# Altium schematic sheet Laser_Driver.SchDoc
size A4; Date: *******; ApprovedBy: *******; CheckedBy: None; Author: *******; CompanyName: *******; DrawnBy: Name; Engineer: *******; Organization: *******; Address1: *******; Address2: *******; Address3: *******; Address4: *******; DocumentNumber: Doc Num; Revision: *******; SheetNumber: 6; SheetTotal: 8; CurrentTime: *******; CurrentDate: *******; Time: *******; DocumentFullPathAndName: *******; DocumentName: *******; ModifiedDate: *******; ImagePath: *******; ProjectName: *******; Application_BuildNumber: *******
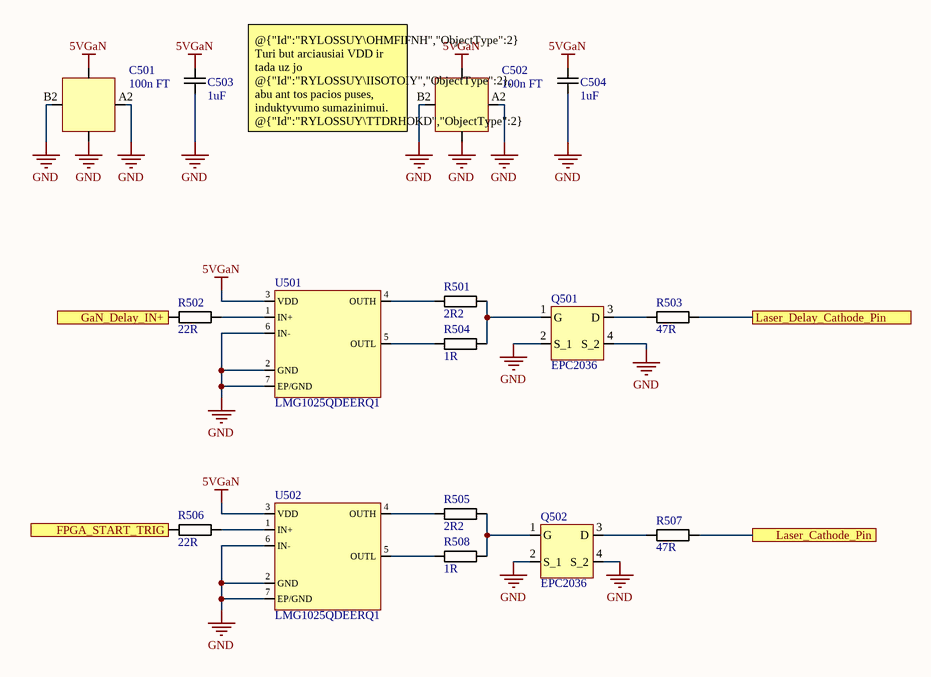
[diagram p0: Laser_Driver.SchDoc]

## Parts
C501  100n FT  [100n FT 0603]
C502  100n FT  [100n FT 0603]
C503  1uF  [1uF 0603]
C504  1uF  [1uF 0603]
Q501  EPC2036  [EPC2036]
Q502  EPC2036  [EPC2036]
R501  2R2  [2R2 0402]
R502  22R  [22R 0402]
R503  47R  [1R 0402]
R504  1R  [1R 0402]
R505  2R2  [2R2 0402]
R506  22R  [22R 0402]
R507  47R  [1R 0402]
R508  1R  [1R 0402]
U501  LMG1025QDEERQ1  [LMG1025QDEERQ1]
U502  LMG1025QDEERQ1  [LMG1025QDEERQ1]

## Ports
FPGA_START_TRIG (see Inputs_Outputs[3C]), GaN_Delay_IN+ (see Time_Delay[4B]), Laser_Cathode_Pin (see Laser_System[1C]), Laser_Delay_Cathode_Pin (see Laser_System[1B])

## Nets
5VGaN: C501.3(OUTPUT) C502.3(OUTPUT) C503.2 C504.2 U501.3(VDD) U502.3(VDD)
GND: C501.1(INPUT) C501.A2(GND_1) C501.B2(GND_2) C502.1(INPUT) C502.A2(GND_1) C502.B2(GND_2) C503.1 C504.1 Q501.2(S_1) Q501.4(S_2) Q502.2(S_1) Q502.4(S_2) U501.2(GND) U501.6(IN-) U501.7(EP/GND) U502.2(GND) U502.6(IN-) U502.7(EP/GND)
FPGA_START_TRIG: R506.2 ; port FPGA_START_TRIG
GaN_Delay_IN+: R502.2 ; port GaN_Delay_IN+
Laser_Cathode_Pin: R507.2 ; port Laser_Cathode_Pin
Laser_Delay_Cathode_Pin: R503.2 ; port Laser_Delay_Cathode_Pin
NetQ501_1: Q501.1(G) R501.2 R504.2
NetQ501_3: Q501.3(D) R503.1
NetQ502_1: Q502.1(G) R505.2 R508.2
NetQ502_3: Q502.3(D) R507.1
NetR501_1: R501.1 U501.4(OUTH)
NetR502_1: R502.1 U501.1(IN+)
NetR504_1: R504.1 U501.5(OUTL)
NetR505_1: R505.1 U502.4(OUTH)
NetR506_1: R506.1 U502.1(IN+)
NetR508_1: R508.1 U502.5(OUTL)

## Notes on the sheet
- (near C502) @{"Id":"RYLOSSUY\OHMFIFNH","ObjectType":2} Turi but arciausiai VDD ir tada uz jo @{"Id":"RYLOSSUY\IISOTOIY","ObjectType":2}, abu ant tos pacios puses, induktyvumo sumazinimui.
  @{"Id":"RYLOSSUY\TTDRHOKD","ObjectType":2} Slopina visokius nepageidaujemus signalus
- Title:
- Date:
- Author:
- Sheet:
- Of
- File:

## Library data of the parts
C501 C502 = 100n 0603 FT: NFM18PC104R1C3D
C503 C504 = 1uF 0603: CGA3E1X7R1E105K080AC
R501 R505 = 2R2 0402: CRT0402-FZ-2R00GLF
R502 R506 = 22R 0402: ERA-2AKD220X
R503 R507 = 47R 0402: CRCW040247R0FKED
R504 R508 = 1R 0402: CRT0402-FZ-1R00GLF
U501 U502 = LMG1025QDEERQ1: GaN Driver